# Altium schematic sheet Controller_Sheet.SchDoc
size A4; SheetNumber: 2; SheetTotal: 3
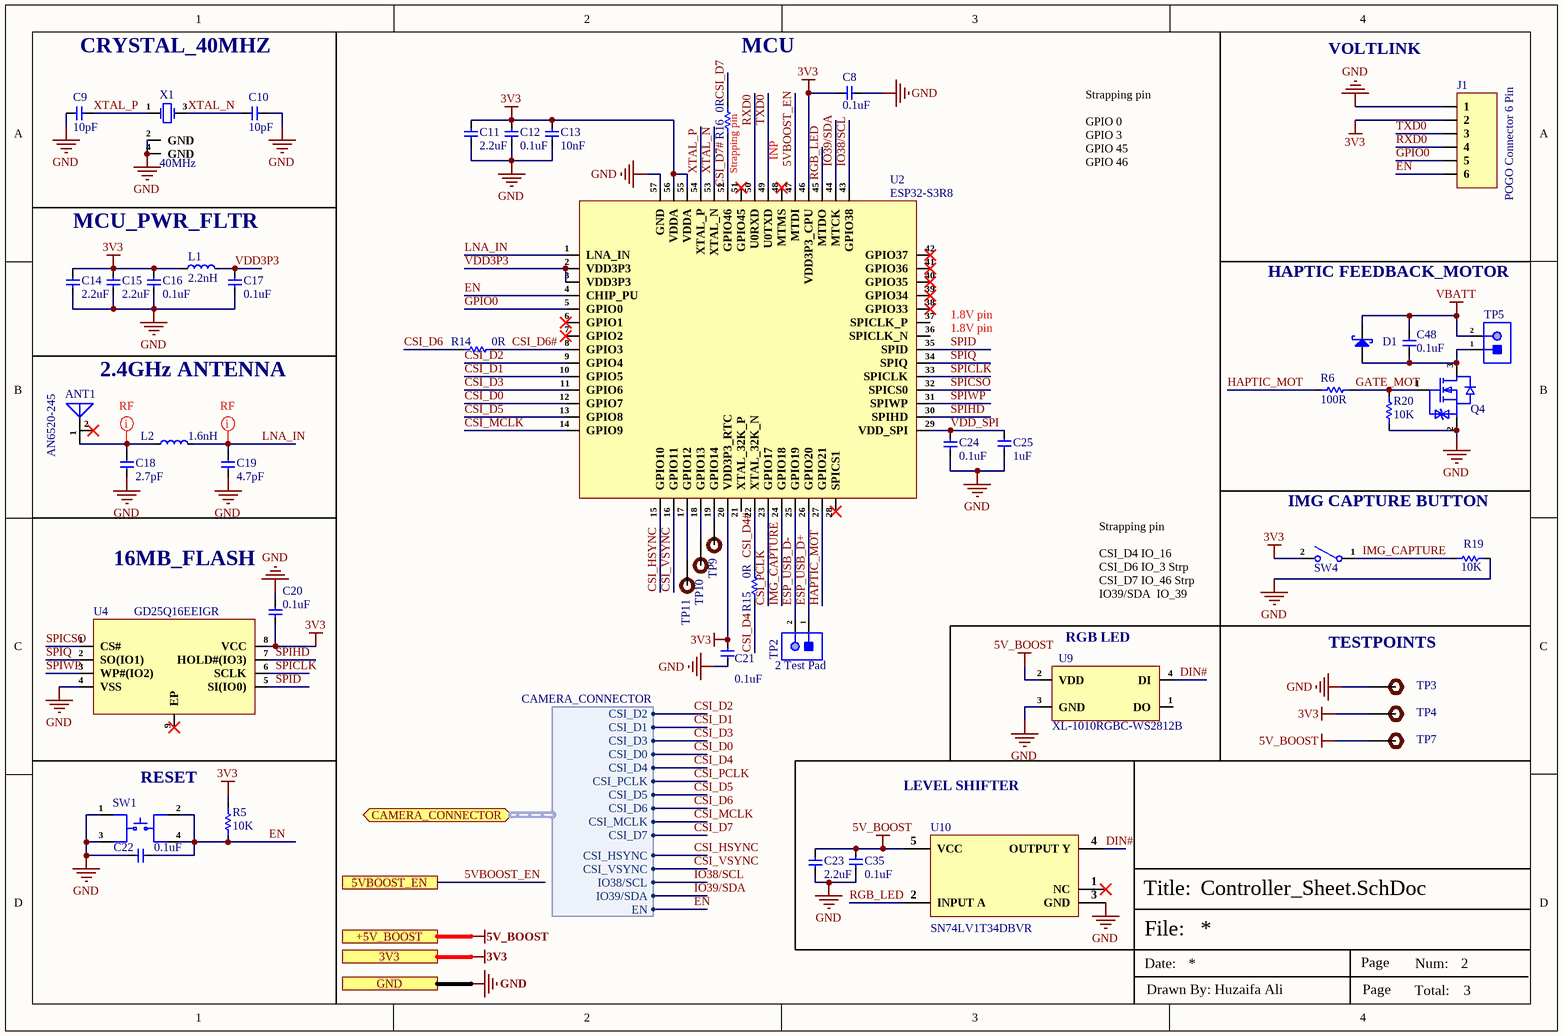
[diagram p0: Controller_Sheet.SchDoc]

## Parts
ANT1  AN6520-245  [AN6520-245]
C8  0.1uF  [CAP-0201]
C9  10pF  [CAP-0201]
C10  10pF  [CAP-0201]
C11  2.2uF  [CAP-0201]
C12  0.1uF  [CAP-0201]
C13  10nF  [CAP-0201]
C14  2.2uF  [CAP-0201]
C15  2.2uF  [CAP-0201]
C16  0.1uF  [CAP-0201]
C17  0.1uF  [CAP-0201]
C18  2.7pF  [CAP-0201]
C19  4.7pF  [CAP-0201]
C20  0.1uF  [CAP-0201]
C21  0.1uF  [CAP-0201]
C22  0.1uF  [CAP-0201]
C23  2.2uF  [CAP-0201]
C24  0.1uF  [CAP-0201]
C25  1uF  [CAP-0201]
C35  0.1uF  [CAP-0201]
C48  0.1uF  [CAP-0201]
D1  LMBR4010BST5G  [SOD-882]  (value not drawn)
J1  POGO Connector 6 Pin  [POGO 6 Pin]
L1  2.2nH  [IND-0201]
L2  1.6nH  [IND-0201]
Q4  RV2C010UNT2L  [DFN1006-3]  (value not drawn)
R5  10K  [Res-0201]
R6  100R  [Res-0201]
R14  0R  [Res-0603]
R15  0R  [Res-0603]
R16  0R  [Res-0603]
R19  10K  [Res-0402]
R20  10K  [Res-0201]
SW1  SKTAAAE010  [SKTAAAE010]  (value not drawn)
SW4  EVQ-P7A01P  [EVQP7A01P]  (value not drawn)
TP2  2 Test Pad  [2 Test Pad]  (no BOM)
TP3  TEST POINT 0.5mm Dia  [Test-point - 0.5mm]  (value not drawn)  (no BOM)
TP4  TEST POINT 0.5mm Dia  [Test-point - 0.5mm]  (value not drawn)  (no BOM)
TP5  2 Test Pad  [2 Test Pad]  (value not drawn)  (no BOM)
TP7  TEST POINT 0.5mm Dia  [Test-point - 0.5mm]  (value not drawn)  (no BOM)
TP9  TEST POINT 0.5mm Dia  [Test-point - 0.5mm]  (value not drawn)  (no BOM)
TP10  TEST POINT 0.5mm Dia  [Test-point - 0.5mm]  (value not drawn)  (no BOM)
TP11  TEST POINT 0.5mm Dia  [Test-point - 0.5mm]  (value not drawn)  (no BOM)
U2  ESP32-S3R8  [56-QFN (7x7)]
U4  GD25Q16EEIGR  [USON-8(2x3)]
U9  XL-1010RGBC-WS2812B  [XL-1010RGBC-WS2812B]
U10  SN74LV1T34DBVR  [SOT-23-5]
X1  40MHz  [X322540MPB4SI_]

## Ports
3V3, 5VBOOST_EN, +5V_BOOST, CAMERA_CONNECTOR (bidir, harness CAMERA_CONNECTOR), GND

## Harnesses
CAMERA_CONNECTOR: CSI_D2, CSI_D1, CSI_D3, CSI_D0, CSI_D4, CSI_PCLK, CSI_D5, CSI_D6, CSI_MCLK, CSI_D7, CSI_HSYNC, CSI_VSYNC, IO38/SCL, IO39/SDA, EN

## Nets
3V3: C8.2 C11.2 C12.2 C13.2 C14.2 C15.2 C16.2 C20.2 C21.2 J1.2 L1.1 R5.2 SW4.2 TP4.1 U2.20(VDD3P3_RTC) U2.46(VDD3P3_CPU) U2.55(VDDA) U2.56(VDDA) U4.8(VCC) ; port 3V3
5V_BOOST: C23.2 C35.1 TP7.1 U9.2(VDD) U10.5(VCC) ; port +5V_BOOST
GND: C8.1 C9.1 C10.2 C11.1 C12.1 C13.1 C14.1 C15.1 C16.1 C17.1 C18.1 C19.1 C20.1 C21.1 C22.2 C23.1 C24.1 C25.2 C35.2 J1.1 Q4.2(S) R19.2 R20.1 SW1.1 SW1.3 TP3.1 U2.57(GND) U4.4(VSS) U9.3(GND) U10.3(GND) X1.2(GND) X1.4(GND) ; port GND
VBATT: C48.2 D1.2(K) TP5.2
5VBOOST_EN: U2.47(MTDI) ; port 5VBOOST_EN
CSI_D0: U2.12(GPIO7) ; port CAMERA_CONNECTOR.CSI_D0
CSI_D1: U2.10(GPIO5) ; port CAMERA_CONNECTOR.CSI_D1
CSI_D2: U2.9(GPIO4) ; port CAMERA_CONNECTOR.CSI_D2
CSI_D3: U2.11(GPIO6) ; port CAMERA_CONNECTOR.CSI_D3
CSI_D4: R15.1 ; port CAMERA_CONNECTOR.CSI_D4
CSI_D4#: R15.2 U2.22(XTAL_32K_N)
CSI_D5: U2.13(GPIO8) ; port CAMERA_CONNECTOR.CSI_D5
CSI_D6: R14.1 ; port CAMERA_CONNECTOR.CSI_D6
CSI_D6#: R14.2 U2.8(GPIO3)
CSI_D7: R16.2 ; port CAMERA_CONNECTOR.CSI_D7
CSI_D7#: R16.1 U2.52(GPIO46)
CSI_HSYNC: U2.15(GPIO10) ; port CAMERA_CONNECTOR.CSI_HSYNC
CSI_MCLK: U2.14(GPIO9) ; port CAMERA_CONNECTOR.CSI_MCLK
CSI_PCLK: U2.23(GPIO17) ; port CAMERA_CONNECTOR.CSI_PCLK
CSI_VSYNC: U2.16(GPIO11) ; port CAMERA_CONNECTOR.CSI_VSYNC
DIN#: U9.4(DI) U10.4(OUTPUT_Y)
EN: C22.1 J1.6 R5.1 SW1.2 SW1.4 U2.4(CHIP_PU) ; port CAMERA_CONNECTOR.EN
ESP_USB_D+: TP2.1 U2.26(GPIO20)
ESP_USB_D-: TP2.2 U2.25(GPIO19)
GATE_MOT: Q4.1(G) R6.2 R20.2
GPIO0: J1.5 U2.5(GPIO0)
HAPTIC_MOT: R6.1 U2.27(GPIO21)
IMG_CAPTURE: R19.1 SW4.1 U2.24(GPIO18)
IO38/SCL: U2.43(GPIO38) ; port CAMERA_CONNECTOR.IO38/SCL
IO39/SDA: U2.44(MTCK) ; port CAMERA_CONNECTOR.IO39/SDA
LNA_IN: C19.2 L2.2 U2.1(LNA_IN)
RGB_LED: U2.45(MTDO) U10.2(INPUT_A)
RXD0: J1.4 U2.50(U0RXD)
SPICLK: U2.33(SPICLK) U4.6(SCLK)
SPICSO: U2.32(SPICS0) U4.1(CS#)
SPID: U2.35(SPID) U4.5(SI(IO0))
SPIHD: U2.30(SPIHD) U4.7(HOLD#(IO3))
SPIQ: U2.34(SPIQ) U4.2(SO(IO1))
SPIWP: U2.31(SPIWP) U4.3(WP#(IO2))
TXD0: J1.3 U2.49(U0TXD)
VDD3P3: C17.2 L1.2 U2.2(VDD3P3) U2.3(VDD3P3)
VDD_SPI: C24.2 C25.1 U2.29(VDD_SPI)
XTAL_N: C10.1 U2.53(XTAL_N) X1.3(CRYSTAL)
XTAL_P: C9.2 U2.54(XTAL_P) X1.1(CRYSTAL)
NetANT1_1: ANT1.1(FEED) C18.2 L2.1
NetC48_1: C48.1 D1.1(A) Q4.3(D) TP5.1
NetTP9_1: TP9.1 U2.19(GPIO14)
NetTP10_1: TP10.1 U2.18(GPIO13)
NetTP11_1: TP11.1 U2.17(GPIO12)

Not connected (* = marked no-connect by the designer): ANT1 2(NC)*; U2 6(GPIO1)* 7(GPIO2)* 21(XTAL_32K_P) 28(SPICS1)* 36(SPICLK_N) 37(SPICLK_P) 38(GPIO33)* 39(GPIO34)* 40(GPIO35)* 41(GPIO36)* 42(GPIO37)* 48(MTMS)* 51(GPIO45)*; U4 9(EP)*; U9 1(DO); U10 1(NC)*

## Layout directives
net class RF: LNA_IN, NetANT1_1

## Notes on the sheet
- CRYSTAL_40MHZ
- MCU
- VOLTLINK
- (near R16) Strapping pin
- INP
- Strapping pin
  GPIO 0
  GPIO 3
  GPIO 45
  GPIO 46
- MCU_PWR_FLTR
- HAPTIC FEEDBACK_MOTOR
- 2.4GHz ANTENNA
- (near U2) 1.8V pin
- IMG CAPTURE BUTTON
- 16MB_FLASH
- (near U9) RGB LED
- Strapping pin
  CSI_D4 IO_16
  CSI_D6 IO_3 Strp
  CSI_D7 IO_46 Strp
  IO39/SDA  IO_39
- (near TP3) TESTPOINTS
- (near SW1) RESET
- LEVEL SHIFTER
- File:
- Title:
- Date:
- Page
- Num:
- Total:
- Drawn By: Huzaifa Ali

## Library data of the parts
ANT1 = AN6520-245: SMD Antennas ROHS; Manufacturer: Rainsun microwave Tech; ComponentLink1Description: LCSC; ComponentLink1URL: https://www.lcsc.com/product-detail/Antennas_Rainsun-microwave-Tech-AN6520-245_C239238.html; Manufacturer Part Number: AN6520-245; Footprint: SMD; LCSC Part Number: C239238
C8 C12 C16 C17 C20-C22 C24 C35 C48 = GRM033C81E104KE14D: CAP CER 0.1UF 25V X6S 0201; Manufacturer: Murata; Capacitance: 100nF; Tolerance: 10%; Supplier 1: Digi-Key; Manufacturer Part Number: GRM033C81E104KE14D; RoHS: Yes; Category: Ceramic Capacitors; Stock 1: 91; Pricing 1: 1=0.10000, 10=0.05100, 50=0.02780, 100=0.02260, 500=0.01616, 1000=0.01270, 2500=0.01155, 5000=0.01063 (USD); Mount: Surface Mount; Case/Package: 0201; Case Code (Metric): 0603; Case Code (Imperial): 0201; Weight: 1.2E-05oz; Min Operating Temperature: -55°C; Max Operating Temperature: 105°C; Packaging: Tape and Reel; Voltage Rating: 25V; Dielectric: X6S; Termination: SMD/SMT; Voltage Rating (DC): 25V; Package Quantity: 15000; Length: 0.024inch; Width: 0.3mm; Height: 0.3mm; Thickness: 0.013inch; RoHS Compliant: Yes; ComponentLink1URL: http://www.mouser.com/ds/2/281/c02e-2905.pdf?src-supplier=Mouser; ComponentLink1Description: http://www.mouser.com/ds/2/281/c02e-2905.pdf?src-supplier=Mouser; ComponentLink2URL: http://www.farnell.com/datasheets/2722733.pdf?src-supplier=Farnell; ComponentLink2Description: http://www.farnell.com/datasheets/2722733.pdf?src-supplier=Farnell; ComponentLink3URL: http://search.murata.co.jp/Ceramy/image/img/A01X/G101/ENG/GRM033C81E104KE14-01.pdf?src-supplier=Digi-Key; ComponentLink3Description: http://search.murata.co.jp/Ceramy/image/img/A01X/G101/ENG/GRM033C81E104KE14-01.pdf?src-supplier=Digi-Key; Supplier Part Number 1: 490-10403-1-ND
C9 C10 = CGA1A2C0G1E100D030BA: CAP CER 10PF 25V C0G 0201; Manufacturer: TDK; Item Type: Capacitor; Supplier 1: Digi-Key; Manufacturer Part Number: CGA1A2C0G1E100D030BA; RoHS: Yes; Category: Ceramic Capacitors; Stock 1: 28695; Pricing 1: 1=0.11000, 10=0.07900, 50=0.04340, 100=0.03540, 500=0.02530, 1000=0.01987, 2500=0.01807, 5000=0.01662 (USD); Mount: Surface Mount; Case/Package: 0201; Case Code (Imperial): 0201; Case Code (Metric): 0603; Weight: 6E-06oz; Min Operating Temperature: -55°C; Max Operating Temperature: 125°C; Packaging: Tape and Reel; Capacitance: 10pF; Voltage Rating: 25V; Termination: SMD/SMT; Voltage Rating (DC): 25V; Package Quantity: 1; Dielectric: C0G; Resistor Type: Ceramic; Series: CGA; Length: 0.6mm; Width: 0.3mm; Height: 0.3mm; Thickness: 0.013inch; Depth: 0.3mm; Ratings: AEC-Q200; RoHS Compliant: Yes; ComponentLink1URL: https://datasheet.ciiva.com/24220/cga1a2c0g1e100d030ba-271838-24220873.pdf?src-supplier=Mouser; ComponentLink1Description: https://datasheet.ciiva.com/24220/cga1a2c0g1e100d030ba-271838-24220873.pdf?src-supplier=Mouser; Supplier Part Number 1: 445-9023-1-ND; LCSC Part Number: C2168728
C11 C14 C15 C23 = CC0201MRX5R6BB225: CAP CER 2.2UF 10V X5R 0201; Manufacturer: Yageo; Tolerance: 20%; Item Type: Capacitor; Supplier: Mouser; Supplier Part Number: 603-CC0201MRX56BB225; Manufacturer Part Number: CC0201MRX5R6BB225; RoHS: Yes; Category: Ceramic Capacitors; Stock: 25553; Pricing: 1=0.43, 10=0.294, 50=0.294, 100=0.176, 1000=0.112, 10000=0.091 (USD); Mounting Technology: Surface Mount; Case/Package: 0201; Min Operating Temperature: -55°C; Max Operating Temperature: 85°C; Packaging: Tape and Reel; Value: 2.2uF; Voltage Rating: 10V; Series: CC; RoHS Compliant: Yes; ComponentLink1URL: https://www.yageo.com/upload/media/product/productsearch/datasheet/mlcc/UPY-GPHC_X5R_4V-to-50V_26.pdf?src-supplier=Digi-Key; ComponentLink1Description: https://www.yageo.com/upload/media/product/productsearch/datasheet/mlcc/UPY-GPHC_X5R_4V-to-50V_26.pdf?src-supplier=Digi-Key; LCSC Part Number: C2186869
C13 = GRM033R71E103KE14D: CAP CER 10000PF 25V X7R 0201; Manufacturer: Murata; Material: 4241ConductorMaterial; Tolerance: 10%; Item Type: Capacitor; Supplier 1: Avnet; Manufacturer Part Number: GRM033R71E103KE14D; RoHS: Yes; Category: Ceramic Capacitors; Stock 1: 60000; Pricing 1: 15000=0.00231 (USD); Mount: Surface Mount; Case/Package: 0201; Min Operating Temperature: -55°C; Max Operating Temperature: 125°C; Voltage Rating (DC): 25V; Dielectric: X7R; Capacitance: 10nF; Series: GRM; Voltage Rating: 25V; Length: 600um; Width: 300um; Height: 330um; Thickness: 300um; RoHS Compliant: Yes; ComponentLink1URL: http://www.farnell.com/datasheets/2867850.pdf?src-supplier=Farnell; ComponentLink1Description: http://www.farnell.com/datasheets/2867850.pdf?src-supplier=Farnell; ComponentLink2URL: http://www.farnell.com/datasheets/2867850.pdf?src-supplier=Element14; ComponentLink2Description: http://www.farnell.com/datasheets/2867850.pdf?src-supplier=Element14; ComponentLink3URL: http://search.murata.co.jp/Ceramy/image/img/A01X/G101/ENG/GRM033R71E103KE14-01.pdf?src-supplier=Digi-Key; ComponentLink3Description: http://search.murata.co.jp/Ceramy/image/img/A01X/G101/ENG/GRM033R71E103KE14-01.pdf?src-supplier=Digi-Key; ComponentLink4URL: https://datasheet.octopart.com/GRM033R71E103KE14D-Murata-datasheet-99353822.pdf?src-supplier=Future+Electronics; ComponentLink4Description: https://datasheet.octopart.com/GRM033R71E103KE14D-Murata-datasheet-99353822.pdf?src-supplier=Future+Electronics; ComponentLink5URL: http://www.farnell.com/datasheets/2867850.pdf?src-supplier=Newark; ComponentLink5Description: http://www.farnell.com/datasheets/2867850.pdf?src-supplier=Newark; ComponentLink6URL: https://datasheet.octopart.com/GRM033R71E103KE14D-Murata-datasheet-165579666.pdf?src-supplier=TME; ComponentLink6Description: https://datasheet.octopart.com/GRM033R71E103KE14D-Murata-datasheet-165579666.pdf?src-supplier=TME; Supplier Part Number 1: GRM033R71E103KE14D; LCSC Part Number: C85930
C18 = CC0201CRNPO9BN2R7: CAP CER 2.7PF 50V C0G/NPO 0201; Manufacturer: Yageo; Dielectric: C0G; Item Type: Capacitor; Supplier: Avnet; Supplier Part Number: CC0201CRNPO9BN2R7; Manufacturer Part Number: CC0201CRNPO9BN2R7; RoHS: Yes; Category: Ceramic Capacitors; Stock: 15000; Pricing: 15000=0.0017 (USD); Mounting Technology: Surface Mount; Case/Package: 0201; Case Code (Imperial): 0201; Case Code (Metric): 0603; Weight: 6E-06oz; Min Operating Temperature: -55°C; Max Operating Temperature: 125°C; Value: 2.7pF; Packaging: Tape and Reel; Voltage Rating (DC): 50V; Voltage Rating: 50V; Termination: SMD/SMT; Series: CC; Length: 0.024inch; Width: 0.012inch; Thickness: 0.013inch; RoHS Compliant: Yes; ComponentLink1URL: https://datasheet.ciiva.com/13208/upy-gp-np0-16v-to-50v-8-13208314.pdf?src-supplier=Mouser; ComponentLink1Description: https://datasheet.ciiva.com/13208/upy-gp-np0-16v-to-50v-8-13208314.pdf?src-supplier=Mouser; LCSC Part Number: C325439
C19 = CC0201BRNPO9BN4R7: CAP CER 4.7PF 50V C0G/NPO 0201; Manufacturer: Yageo; Item Type: Capacitor; Supplier: Arrow Electronics; Supplier Part Number: CC0201BRNPO9BN4R7; Manufacturer Part Number: CC0201BRNPO9BN4R7; RoHS: Yes; Category: Ceramic Capacitors; Stock: 210000; Pricing: 15000=0.0023 (USD); Mounting Technology: Surface Mount; Case/Package: 0201; Min Operating Temperature: -55°C; Max Operating Temperature: 125°C; Packaging: Tape and Reel; Value: 4.7pF; Voltage Rating: 50V; Series: CC; Length: 0.024inch; Width: 0.012inch; Thickness: 0.013inch; RoHS Compliant: Yes; ComponentLink1URL: https://www.yageo.com/upload/media/product/productsearch/datasheet/mlcc/UPY-GP_NP0_16V-to-50V_18.pdf?src-supplier=Digi-Key; ComponentLink1Description: https://www.yageo.com/upload/media/product/productsearch/datasheet/mlcc/UPY-GP_NP0_16V-to-50V_18.pdf?src-supplier=Digi-Key; ComponentLink2URL: http://www.yageo.com/documents/recent/UPY-GP_NP0_16V-to-50V_16.pdf?src-supplier=Digi-Key; ComponentLink2Description: http://www.yageo.com/documents/recent/UPY-GP_NP0_16V-to-50V_16.pdf?src-supplier=Digi-Key; LCSC Part Number: C505471
C25 = CC0201MRX5R7BB105: CAP CER 1UF 16V X5R 0201; Manufacturer: Yageo; Item Type: Capacitor; Supplier: Digi-Key; Supplier Part Number: 13-CC0201MRX5R7BB105TR-ND; Manufacturer Part Number: CC0201MRX5R7BB105; RoHS: Yes; Category: Ceramic Capacitors; LCSC Part Number: C5182464
D1 = LMBR4010BST5G: 40V Independent Type 1A 600mV SOD-882 Schottky Diodes ROHS; Manufacturer: LRC; Item Type: Diode; Manufacturer Part Number: LMBR4010BST5G; Package: SOD-882; LCSC Part Number: C2912031; ComponentLink1Description: LCSC; ComponentLink1URL: https://www.lcsc.com/product-detail/Schottky-Barrier-Diodes-SBD_LRC-LMBR4010BST5G_C2912031.html
J1 = POGO Connector 6 Pin: Pogo Pad 2.5mm 6 Pin
L1 = LQP03TG2N2B02D: FIXED IND 2.2NH 450MA 250MOHM SM; Manufacturer: Murata; Item Type: Inductors; Shielding: Unshielded; DC Resistance (DCR): 250mR; Self Resonant Frequency: 6GHz; Test Frequency: 500MHz; Supplier: Mouser; LCSC Part Number: C341782; Manufacturer Part Number: LQP03TG2N2B02D; RoHS: Yes; Stock: 35433; Pricing: 1=0.1, 10=0.021, 50=0.021, 100=0.015, 1000=0.013, 10000=0.01 (USD); Mounting Technology: Surface Mount; Case/Package: 0201; Min Operating Temperature: -55°C; Max Operating Temperature: 125°C; Current Rating: 450mA; Packaging: Tape and Reel; Series: LQP03TG_02; Package Quantity: 15000; Value: 2.2nH; Max DC Current: 450mA; DC Current: 450mA; Technology: THIN FILM; Length: 0.024inch; Width: 0.012inch; Height: 0.3mm; Depth: 0.33mm; Height - Seated (Max): 0.013inch; Military Standard: Not; RoHS Compliant: Yes; ComponentLink1URL: https://datasheet.ciiva.com/29691/jelf243c-0016-29691343.pdf?src-supplier=Digikey; ComponentLink1Description: https://datasheet.ciiva.com/29691/jelf243c-0016-29691343.pdf?src-supplier=Digikey
L2 = LQP03HQ1N6B02D: FIXED IND 1.6NH 1A 50 MOHM SMD; Manufacturer: Murata; Core Material: Non-Magnetic; Shielding: Unshielded; DC Resistance (DCR): 50mR; Self Resonant Frequency: 10GHz; Test Frequency: 500MHz; Item Type: Inductor; Supplier: Digi-Key; Supplier Part Number: 490-13883-1-ND; Manufacturer Part Number: LQP03HQ1N6B02D; RoHS: Yes; Category: Fixed Inductors; Stock: 27606; Pricing: 1=0.16, 10=0.145, 25=0.1236, 50=0.109, 100=0.1, 250=0.09088, 500=0.08544, 1000=0.06545, 2500=0.06181 (USD); Mounting Technology: Surface Mount; Case/Package: 0201; Case Code (Imperial): 0201; Case Code (Metric): 0603; Min Operating Temperature: -55°C; Max Operating Temperature: 125°C; Packaging: Cut Tape; Value: 1.6nH; Current Rating: 1A; Series: LQP03; RoHS Compliant: Yes; ComponentLink1URL: http://search.murata.co.jp/Ceramy/image/img/P02/JELF243C-0021.pdf?src-supplier=Digi-Key; ComponentLink1Description: http://search.murata.co.jp/Ceramy/image/img/P02/JELF243C-0021.pdf?src-supplier=Digi-Key; LCSC Part Number: C237384
Q4 = RV2C010UNT2L: MOSFET N-CH 20V 1A DFN1006-3; Manufacturer: Rohm; Item Type: MOSFETs; Drain to Source Resistance: 340mR; Supplier: Mouser; LCSC Part Number: C570828; Manufacturer Part Number: RV2C010UNT2L; RoHS: Yes; Stock: 16470; Pricing: 1=0.42, 10=0.261, 50=0.261, 100=0.123, 1000=0.086, 10000=0.073 (USD); ComponentLink1URL: http://www.mouser.com/ds/2/348/rv2c010un-e-1139137.pdf?src-supplier=Mouser; ComponentLink1Description: http://www.mouser.com/ds/2/348/rv2c010un-e-1139137.pdf?src-supplier=Mouser; ComponentLink2URL: http://www.farnell.com/datasheets/1945594.pdf?src-supplier=Farnell; ComponentLink2Description: http://www.farnell.com/datasheets/1945594.pdf?src-supplier=Farnell; ComponentLink3URL: https://www.rohm.com/datasheet/RV2C010UN/rv2c010un-e?src-supplier=Digikey; ComponentLink3Description: https://www.rohm.com/datasheet/RV2C010UN/rv2c010un-e?src-supplier=Digikey; ComponentLink4URL: http://rohmfs.rohm.com/en/techdata_basic/transistor/taping/VML1006_T2L_taping.pdf?src-supplier=Digikey; ComponentLink4Description: http://rohmfs.rohm.com/en/techdata_basic/transistor/taping/VML1006_T2L_taping.pdf?src-supplier=Digikey; ComponentLink5URL: http://rohmfs.rohm.com/en/products/databook/datasheet/discrete/transistor/mosfet/rv2c010unt2l.pdf?src-supplier=Avnet; ComponentLink5Description: http://rohmfs.rohm.com/en/products/databook/datasheet/discrete/transistor/mosfet/rv2c010unt2l.pdf?src-supplier=Avnet; ComponentLink6URL: https://datasheet.octopart.com/RV2C010UNT2L-Rohm-datasheet-57364635.pdf?src-supplier=Element14; ComponentLink6Description: https://datasheet.octopart.com/RV2C010UNT2L-Rohm-datasheet-57364635.pdf?src-supplier=Element14
R5 R20 = RC0201FR-0710KL: RES SMD 10K OHM 1% 1/20W 0201; Manufacturer: Yageo; Item Type: Resistor; Manufacturer Part Number: RC0201FR-0710KL; Package: 0201; ComponentLink7Description: LCSC; ComponentLink7URL: https://www.lcsc.com/product-detail/Chip-Resistor-Surface-Mount_YAGEO-RC0201FR-0710KL_C106225.html; LCSC Part Number: C106225
R6 = RC0201FR-07100RL: RES 100 OHM Thick Film 0201 1% 1/20W ±200ppm/°C Molded SMD SMD Paper T/R; Manufacturer: Yageo; Power Rating: 50mW; Voltage Rating: 25V; Item Type: Resistor; Supplier: Digi-Key; Supplier Part Number: 311-100MCT-ND; Manufacturer Part Number: RC0201FR-07100RL; RoHS: Yes; Category: Chip SMD Resistors; Stock: 193246; Pricing: 1=0.1, 10=0.027, 50=0.0172, 100=0.0143, 500=0.00988, 1000=0.00854, 5000=0.00629 (USD); Case/Package: 0201; Contact Plating: Tin,Matte; Case Code (Metric): 0603; Package: 0201; Min Operating Temperature: -55°C; Max Operating Temperature: 125°C; Value: 100R; Tolerance: 1%; Resistor Type: Thick Film; Temperature Coefficient: 200ppm/°C; Packaging: Cut Tape; Package Quantity: 1; Number of Terminations: 2; Termination: SMD/SMT; Max Power Dissipation: 50mW; Features: Moisture Resistant; Series: RC; Resistance Tolerance: 1%; Length: 0.024inch; Width: 0.012inch; Height: 0.01inch; Lead Free: Lead Free; RoHS Compliant: Yes; Reach SVHC Compliant: Unknown; ComponentLink1URL: https://datasheet.ciiva.com/2560/pyu-r-int-thick-7-2560866.pdf?src-supplier=Digi-Key; ComponentLink1Description: https://datasheet.ciiva.com/2560/pyu-r-int-thick-7-2560866.pdf?src-supplier=Digi-Key; ComponentLink2URL: https://datasheet.ciiva.com/2560/pyu-r-int-thick-7-2560867.pdf?src-supplier=Digi-Key; ComponentLink2Description: https://datasheet.ciiva.com/2560/pyu-r-int-thick-7-2560867.pdf?src-supplier=Digi-Key; ComponentLink3URL: https://datasheet.ciiva.com/2560/pyu-r-int-thick-7-2560865.pdf?src-supplier=Digi-Key; ComponentLink3Description: https://datasheet.ciiva.com/2560/pyu-r-int-thick-7-2560865.pdf?src-supplier=Digi-Key; ComponentLink4URL: https://datasheet.ciiva.com/8887/pyu-rc0201-51-rohs-l-8-8887865.pdf?src-supplier=Avnet; ComponentLink4Description: https://datasheet.ciiva.com/8887/pyu-rc0201-51-rohs-l-8-8887865.pdf?src-supplier=Avnet; LCSC Part Number: C77623; ComponentLink5Description: LCSC; ComponentLink5URL: https://www.lcsc.com/product-detail/Chip-Resistor-Surface-Mount_YAGEO-RC0201FR-07100RL_C77623.html
R14-R16 = RC0603JR-070RL: RES 0 OHM JUMPER 1/10W 0603; Manufacturer: Yageo; Resistance: 0mR; Tolerance: 1%; Power Rating: 100mW; Voltage Rating (DC): 50V; Temperature Coefficient: 200ppm/°C; Resistance Tolerance: 5%; Item Type: Resistor; Supplier 1: Digi-Key; Manufacturer Part Number: RC0603JR-070RL; RoHS: Yes; Category: Chip SMD Resistors; Stock 1: 18081776; Pricing 1: 1=0.10000, 10=0.01700, 25=0.01240, 50=0.00960, 100=0.00700, 250=0.00536, 500=0.00430, 1000=0.00316 (USD); Case/Package: 0603; Number of Pins: 2; Contact Plating: Tin,Matte; Case Code (Imperial): 0603; Case Code (Metric): 1608; Size Code: 0603; Min Operating Temperature: -55°C; Max Operating Temperature: 155°C; Resistor Type: Thick Film; Packaging: Tape and Reel; Termination: SMD/SMT; Series: RC; Technology: THICK FILM; Package Quantity: 5000; Voltage Rating: 50V; Features: Moisture Resistant; Max Power Dissipation: 100mW; Number of Terminations: 2; Construction: Rectangular; Length: 1.6mm; Width: 0.8mm; Height: 0.45mm; Depth: 0.8mm; Radiation Hardening: No; Reach SVHC Compliant: No SVHC; Lead Free: Lead Free; RoHS Compliant: Yes; Military Standard: Not; Supplier Part Number 1: 311-0.0GRCT-ND; LCSC Part Number: C95177
R19 = RC0402FR-0710KL: RES 10K OHM 1% 1/16W 0402; Manufacturer: Yageo; Resistance: 10kR; Voltage Rating (DC): 50V; Temperature Coefficient: 100ppm/°C; Power Rating: 62.5mW; Max Power Dissipation: 63mW; Item Type: Resistor; Supplier 1: Mouser; Manufacturer Part Number: RC0402FR-0710KL; RoHS: Yes; Category: Chip SMD Resistors; Stock 1: 18648329; Pricing 1: 1=0.10000, 10=0.01400, 50=0.01400, 100=0.00500, 1000=0.00300, 10000=0.00200 (USD); Case/Package: 0402; Number of Pins: 2; Case Code (Imperial): 0402; Case Code (Metric): 1005; Min Operating Temperature: -55°C; Max Operating Temperature: 155°C; Resistor Type: Thick Film; Tolerance: 1%; Packaging: Tape and Reel; Voltage Rating: 50V; Termination: SMD/SMT; Working Voltage: 50V; Number of Terminations: 2; Features: Moisture Resistant; Series: RC; Resistance Tolerance: 1%; Construction: Rectangular; Length: 1mm; Width: 0.5mm; Height: 0.32mm; Depth: 0.5mm; Lead Pitch: 0.2mm; REACH SVHC: No SVHC; Lead Free: Lead Free; RoHS Compliant: Yes; Military Standard: Not; ComponentLink1URL: https://datasheet.ciiva.com/7660/38568-7660787.pdf?src-supplier=Element14; ComponentLink1Description: https://datasheet.ciiva.com/7660/38568-7660787.pdf?src-supplier=Element14; ComponentLink2URL: https://datasheet.ciiva.com/7849/1686128-7849814.pdf?src-supplier=Element14; ComponentLink2Description: https://datasheet.ciiva.com/7849/1686128-7849814.pdf?src-supplier=Element14; ComponentLink3URL: https://datasheet.ciiva.com/7983/1018594-7983486.pdf?src-supplier=Element14; ComponentLink3Description: https://datasheet.ciiva.com/7983/1018594-7983486.pdf?src-supplier=Element14; ComponentLink4URL: https://datasheet.ciiva.com/22747/1018594-22747512.pdf?src-supplier=Element14; ComponentLink4Description: https://datasheet.ciiva.com/22747/1018594-22747512.pdf?src-supplier=Element14; ComponentLink5URL: https://datasheet.ciiva.com/12667/pyu-rc0402-51-rohs-l-6-r-12667067.pdf?src-supplier=Mouser; ComponentLink5Description: https://datasheet.ciiva.com/12667/pyu-rc0402-51-rohs-l-6-r-12667067.pdf?src-supplier=Mouser; ComponentLink6URL: https://datasheet.ciiva.com/7849/1784430-7849813.pdf?src-supplier=Element14; ComponentLink6Description: https://datasheet.ciiva.com/7849/1784430-7849813.pdf?src-supplier=Element14; ComponentLink7URL: https://datasheet.ciiva.com/7849/1784430-7849815.pdf?src-supplier=Element14; ComponentLink7Description: https://datasheet.ciiva.com/7849/1784430-7849815.pdf?src-supplier=Element14; Supplier Part Number 1: 603-RC0402FR-0710KL; LCSC Part Number: C60490
SW1 = SKTAAAE010: SWITCH TACTILE SPST-NO 0.05A 12V; Manufacturer: Alps Electric; Item Type: Tactile Switches; Supplier: Digikey; LCSC Part Number: C358616; Manufacturer Part Number: SKTAAAE010; RoHS: Yes; Stock: 54831; Pricing: 1=0.4, 10=0.348, 25=0.3256, 100=0.2911, 250=0.26972, 500=0.25456, 1000=0.24043, 2500=0.22353, 5000=0.21213 (USD); RoHS Compliant: Yes
SW4 = EVQ-P7A01P: SWITCH TACTILE SPST-NO 0.05A 12V; Manufacturer: Panasonic; Mechanical Life: 100000Cycles; Actuator Color: Black; Throw Configuration: SPST; Operating Force: 2.2N; Contact Resistance: 500mR; Illumination Type: Non-Illuminated; Contact Current Rating: 50mA; Switch Travel: 0.2mm; Switch Function: Off-Mom; Actuator Length: 0.65mm; Item Type: Tactile Switch; Supplier: Mouser; Supplier Part Number: 667-EVQP7A01P; Manufacturer Part Number: EVQ-P7A01P; RoHS: Yes; Category: Tactile Switches; Stock: 47904; Pricing: 1=0.28, 10=0.258, 50=0.258, 100=0.213, 1000=0.169, 10000=0.133 (USD); Mounting Technology: Surface Mount; Case/Package: SMD/SMT; Min Operating Temperature: -20°C; Max Operating Temperature: 70°C; Max Voltage Rating (DC): 12V; Packaging: Tape and Reel; Package Quantity: 5000; Termination: Gull Wing; Electrical Life: 100000Cycles; Orientation: Right Angle; Series: EVQP7; Radiation Hardening: No; Lead Free: Lead Free; Reach SVHC Compliant: Unknown; ComponentLink1URL: http://uk.rs-online.com/webdocs/13a5/0900766b813a5dbe.pdf?src-supplier=Rs; ComponentLink1Description: http://uk.rs-online.com/webdocs/13a5/0900766b813a5dbe.pdf?src-supplier=Rs; ComponentLink2URL: http://datasheet.octopart.com/EVQ-P7A01P-Panasonic-datasheet-98950114.pdf?src-supplier=Rs; ComponentLink2Description: http://datasheet.octopart.com/EVQ-P7A01P-Panasonic-datasheet-98950114.pdf?src-supplier=Rs; ComponentLink3URL: https://www3.panasonic.biz/ac/e_download/control/switch/light-touch/catalog/sw_lt_eng_3529s_side.pdf?src-supplier=Verical; ComponentLink3Description: https://www3.panasonic.biz/ac/e_download/control/switch/light-touch/catalog/sw_lt_eng_3529s_side.pdf?src-supplier=Verical; ComponentLink4URL: https://www3.panasonic.biz/ac/e_download/control/switch/light-touch/catalog/sw_lt_eng_3529s_side.pdf?src-supplier=Onlinecomponents.com; ComponentLink4Description: https://www3.panasonic.biz/ac/e_download/control/switch/light-touch/catalog/sw_lt_eng_3529s_side.pdf?src-supplier=Onlinecomponents.com; ComponentLink5URL: https://www3.panasonic.biz/ac/e_download/control/switch/light-touch/catalog/sw_lt_eng_3529s_side.pdf?src-supplier=Arrow+Electronics; ComponentLink5Description: https://www3.panasonic.biz/ac/e_download/control/switch/light-touch/catalog/sw_lt_eng_3529s_side.pdf?src-supplier=Arrow+Electronics; ComponentLink6URL: https://www3.panasonic.biz/ac/e_download/control/switch/light-touch/catalog/sw_lt_eng_3529s_side.pdf?src-supplier=Avnet; ComponentLink6Description: https://www3.panasonic.biz/ac/e_download/control/switch/light-touch/catalog/sw_lt_eng_3529s_side.pdf?src-supplier=Avnet; ComponentLink7URL: http://www.farnell.com/datasheets/1790605.pdf?src-supplier=Newark; ComponentLink7Description: http://www.farnell.com/datasheets/1790605.pdf?src-supplier=Newark; ComponentLink8URL: https://datasheet.octopart.com/EVQ-P7A01P-Panasonic-datasheet-98950114.pdf?src-supplier=Future+Electronics; ComponentLink8Description: https://datasheet.octopart.com/EVQ-P7A01P-Panasonic-datasheet-98950114.pdf?src-supplier=Future+Electronics; ComponentLink9URL: https://www3.panasonic.biz/ac/e_download/control/switch/light-touch/catalog/sw_lt_eng_3529s_side.pdf?src-supplier=Mouser; ComponentLink9Description: https://www3.panasonic.biz/ac/e_download/control/switch/light-touch/catalog/sw_lt_eng_3529s_side.pdf?src-supplier=Mouser; ComponentLink10URL: https://www3.panasonic.biz/ac/e_download/control/switch/light-touch/catalog/sw_lt_eng_3529s_side.pdf?src-supplier=Allied+Electronics; ComponentLink10Description: https://www3.panasonic.biz/ac/e_download/control/switch/light-touch/catalog/sw_lt_eng_3529s_side.pdf?src-supplier=Allied+Electronics; ComponentLink11URL: http://datasheet.octopart.com/EVQ-P7A01P-Panasonic-datasheet-98950114.pdf?src-supplier=Future+Electronics; ComponentLink11Description: http://datasheet.octopart.com/EVQ-P7A01P-Panasonic-datasheet-98950114.pdf?src-supplier=Future+Electronics; ComponentLink12URL: http://datasheet.octopart.com/EVQ-P7A01P-Panasonic-datasheet-98950114.pdf?src-supplier=Distrelec; ComponentLink12Description: http://datasheet.octopart.com/EVQ-P7A01P-Panasonic-datasheet-98950114.pdf?src-supplier=Distrelec; ComponentLink13URL: http://datasheet.octopart.com/EVQ-P7A01P-Panasonic-datasheet-98950114.pdf?src-supplier=Farnell; ComponentLink13Description: http://datasheet.octopart.com/EVQ-P7A01P-Panasonic-datasheet-98950114.pdf?src-supplier=Farnell; ComponentLink14URL: http://www.farnell.com/datasheets/1790605.pdf?src-supplier=Element14; ComponentLink14Description: http://www.farnell.com/datasheets/1790605.pdf?src-supplier=Element14; ComponentLink15URL: http://industrial.panasonic.com/www-data/pdf/ATK0000/ATK0000CE20.pdf?src-supplier=Farnell; ComponentLink15Description: http://industrial.panasonic.com/www-data/pdf/ATK0000/ATK0000CE20.pdf?src-supplier=Farnell; ComponentLink16URL: http://datasheet.octopart.com/EVQ-P7A01P-Panasonic-datasheet-98950114.pdf?src-supplier=Newark; ComponentLink16Description: http://datasheet.octopart.com/EVQ-P7A01P-Panasonic-datasheet-98950114.pdf?src-supplier=Newark; ComponentLink17URL: https://datasheet.octopart.com/EVQ-P7A01P-Panasonic-datasheet-22087671.pdf?src-supplier=Electro+Sonic; ComponentLink17Description: https://datasheet.octopart.com/EVQ-P7A01P-Panasonic-datasheet-22087671.pdf?src-supplier=Electro+Sonic; ComponentLink18URL: http://datasheet.octopart.com/EVQ-P7A01P-Panasonic-datasheet-98950114.pdf?src-supplier=Quest; ComponentLink18Description: http://datasheet.octopart.com/EVQ-P7A01P-Panasonic-datasheet-98950114.pdf?src-supplier=Quest; ComponentLink19URL: https://www3.panasonic.biz/ac/e_download/control/switch/light-touch/catalog/sw_lt_eng_3529s_side.pdf?src-supplier=TTI; ComponentLink19Description: https://www3.panasonic.biz/ac/e_download/control/switch/light-touch/catalog/sw_lt_eng_3529s_side.pdf?src-supplier=TTI; ComponentLink20URL: https://www3.panasonic.biz/ac/e_download/control/switch/light-touch/catalog/sw_lt_eng_3529s_side.pdf?src-supplier=NAC+Semi; ComponentLink20Description: https://www3.panasonic.biz/ac/e_download/control/switch/light-touch/catalog/sw_lt_eng_3529s_side.pdf?src-supplier=NAC+Semi; LCSC Part Number: C79167
TP2 TP5 = 2 Test Pad: Wire Connecting Pad; Item Type: Test Point; Manufacturer Part Number: 2 Test Pad
TP3 TP4 TP7 TP9-TP11 = TEST POINT 0.5mm Dia: Test Point ON; Item Type: Test Point; Manufacturer Part Number: TEST POINT 0.5mm Dia
U2 = ESP32-S3R8: SMD IC ESP32-S3R8, DUAL-CORE MCU; Manufacturer: Espressif Systems; Supplier 1: Mouser; Manufacturer Part Number: ESP32-S3R8; RoHS: No; Category: RF Receivers, Transceivers; Stock 1: 2366; Pricing 1: 1=2.46, 10=2.46, 50=2.46, 100=2.46, 1000=2.46, 10000=2.46 (USD); Supplier Part Number 1: 356-ESP32-S3R8; Item Type: IC
U4 = GD25Q16EEIGR: IC FLASH 16MBIT SPI/QUAD 8USON; Manufacturer: GigaDevice; Supplier: Digikey; LCSC Part Number: C2986331; Manufacturer Part Number: GD25Q16EEIGR; RoHS: No; Item Type: IC; Stock: 2468; Pricing: 1=0.84, 10=0.75, 25=0.7152, 50=0.69, 100=0.6658, 250=0.63504, 500=0.61266, 1000=0.59108 (USD)
U9 = XL-1010RGBC-WS2812B: Colorless transparence -40℃~+150℃ 正贴 RGB 120° 1010 Light Emitting Diodes (LED) ROHS; Manufacturer: XINGLIGHT; Item Type: RGB LED; LCSC Part Number: C5349953; Manufacturer Part Number: XL-1010RGBC-WS2812B; Package: 1010; ComponentLink1Description: LCSC; ComponentLink1URL: https://www.lcsc.com/product-detail/span-style-background-color-ff0-RGB-span-LEDs-Built-in-IC_XINGLIGHT-XL-1010RGBC-WS2812B_C5349953.html
U10 = SN74LV1T34DBVR: IC BUF NON-INVERT 5.5V SOT23-5; Manufacturer: Texas Instruments; Number of Elements: 1; Logic Function: Buffer,Inverting; High Level Output Current: -8mA; Low Level Output Current: 8mA; Min Supply Voltage: 1.6V; Polarity: Non-Inverting; Propagation Delay: 15.5ns; Quiescent Current: 1uA; Supplier 1: Digi-Key; Manufacturer Part Number: SN74LV1T34DBVR; Stock 1: 37360; Pricing 1: 1=0.43, 10=0.349, 25=0.3192, 100=0.2374, 250=0.2152, 500=0.17808, 1000=0.13356 (USD); Mount: Surface Mount; Case/Package: SOT-23-5; Number of Pins: 5; Weight: 0.000353oz; Min Operating Temperature: -40°C; Max Operating Temperature: 125°C; Packaging: Tape and Reel; Number of Bits per Element: 1; Number of Bits: 1; Package Quantity: 3000; Max Supply Voltage: 5.5V; Number of Input Lines: 1; Number of Output Lines: 1; Operating Supply Current: 8mA; Number of Channels: 1; Number of Inputs: 1; Number of Outputs: 1; Radiation Hardening: No; RoHS Compliant: Yes; REACH SVHC: No SVHC; Lead Free: Lead Free; ComponentLink1URL: http://www.ti.com/lit/pdf/sdyu001?src-supplier=Digi-Key; ComponentLink1Description: http://www.ti.com/lit/pdf/sdyu001?src-supplier=Digi-Key; ComponentLink2URL: http://www.ti.com/lit/ds/symlink/sn74lv1t34.pdf?src-supplier=Avnet; ComponentLink2Description: http://www.ti.com/lit/ds/symlink/sn74lv1t34.pdf?src-supplier=Avnet; Supplier Part Number 1: 296-37176-6-ND; LCSC Part Number: C100024; Item Type: IC
X1 = X322540MPB4SI: 40MHz SMD Crystal Resonator 15pF SMD3225-4P Crystals ROHS; Manufacturer: Yangxing Tech; Manufacturer Part Number: X322540MPB4SI; Value: 40MHZ; LCSC Part Number: C9010; ComponentLink1Description: LCSC; ComponentLink1URL: https://www.lcsc.com/product-detail/Crystals_Yangxing-Tech-X322540MPB4SI_C9010.html; Item Type: Crystal